# EasyEDA Pro project ProPrj_STM32H723、_2026-06-01.epro, schematic Schematic1

## Sheets
1 P1: Board Name: Board1; Create Date: 2025-07-23; Page Name: P1; Project Name: STM32H723、; Schematic Name: Schematic1; Update Date: 2025-07-23; Company: 嘉立创EDA; Page Size: A4; Version: V1.0
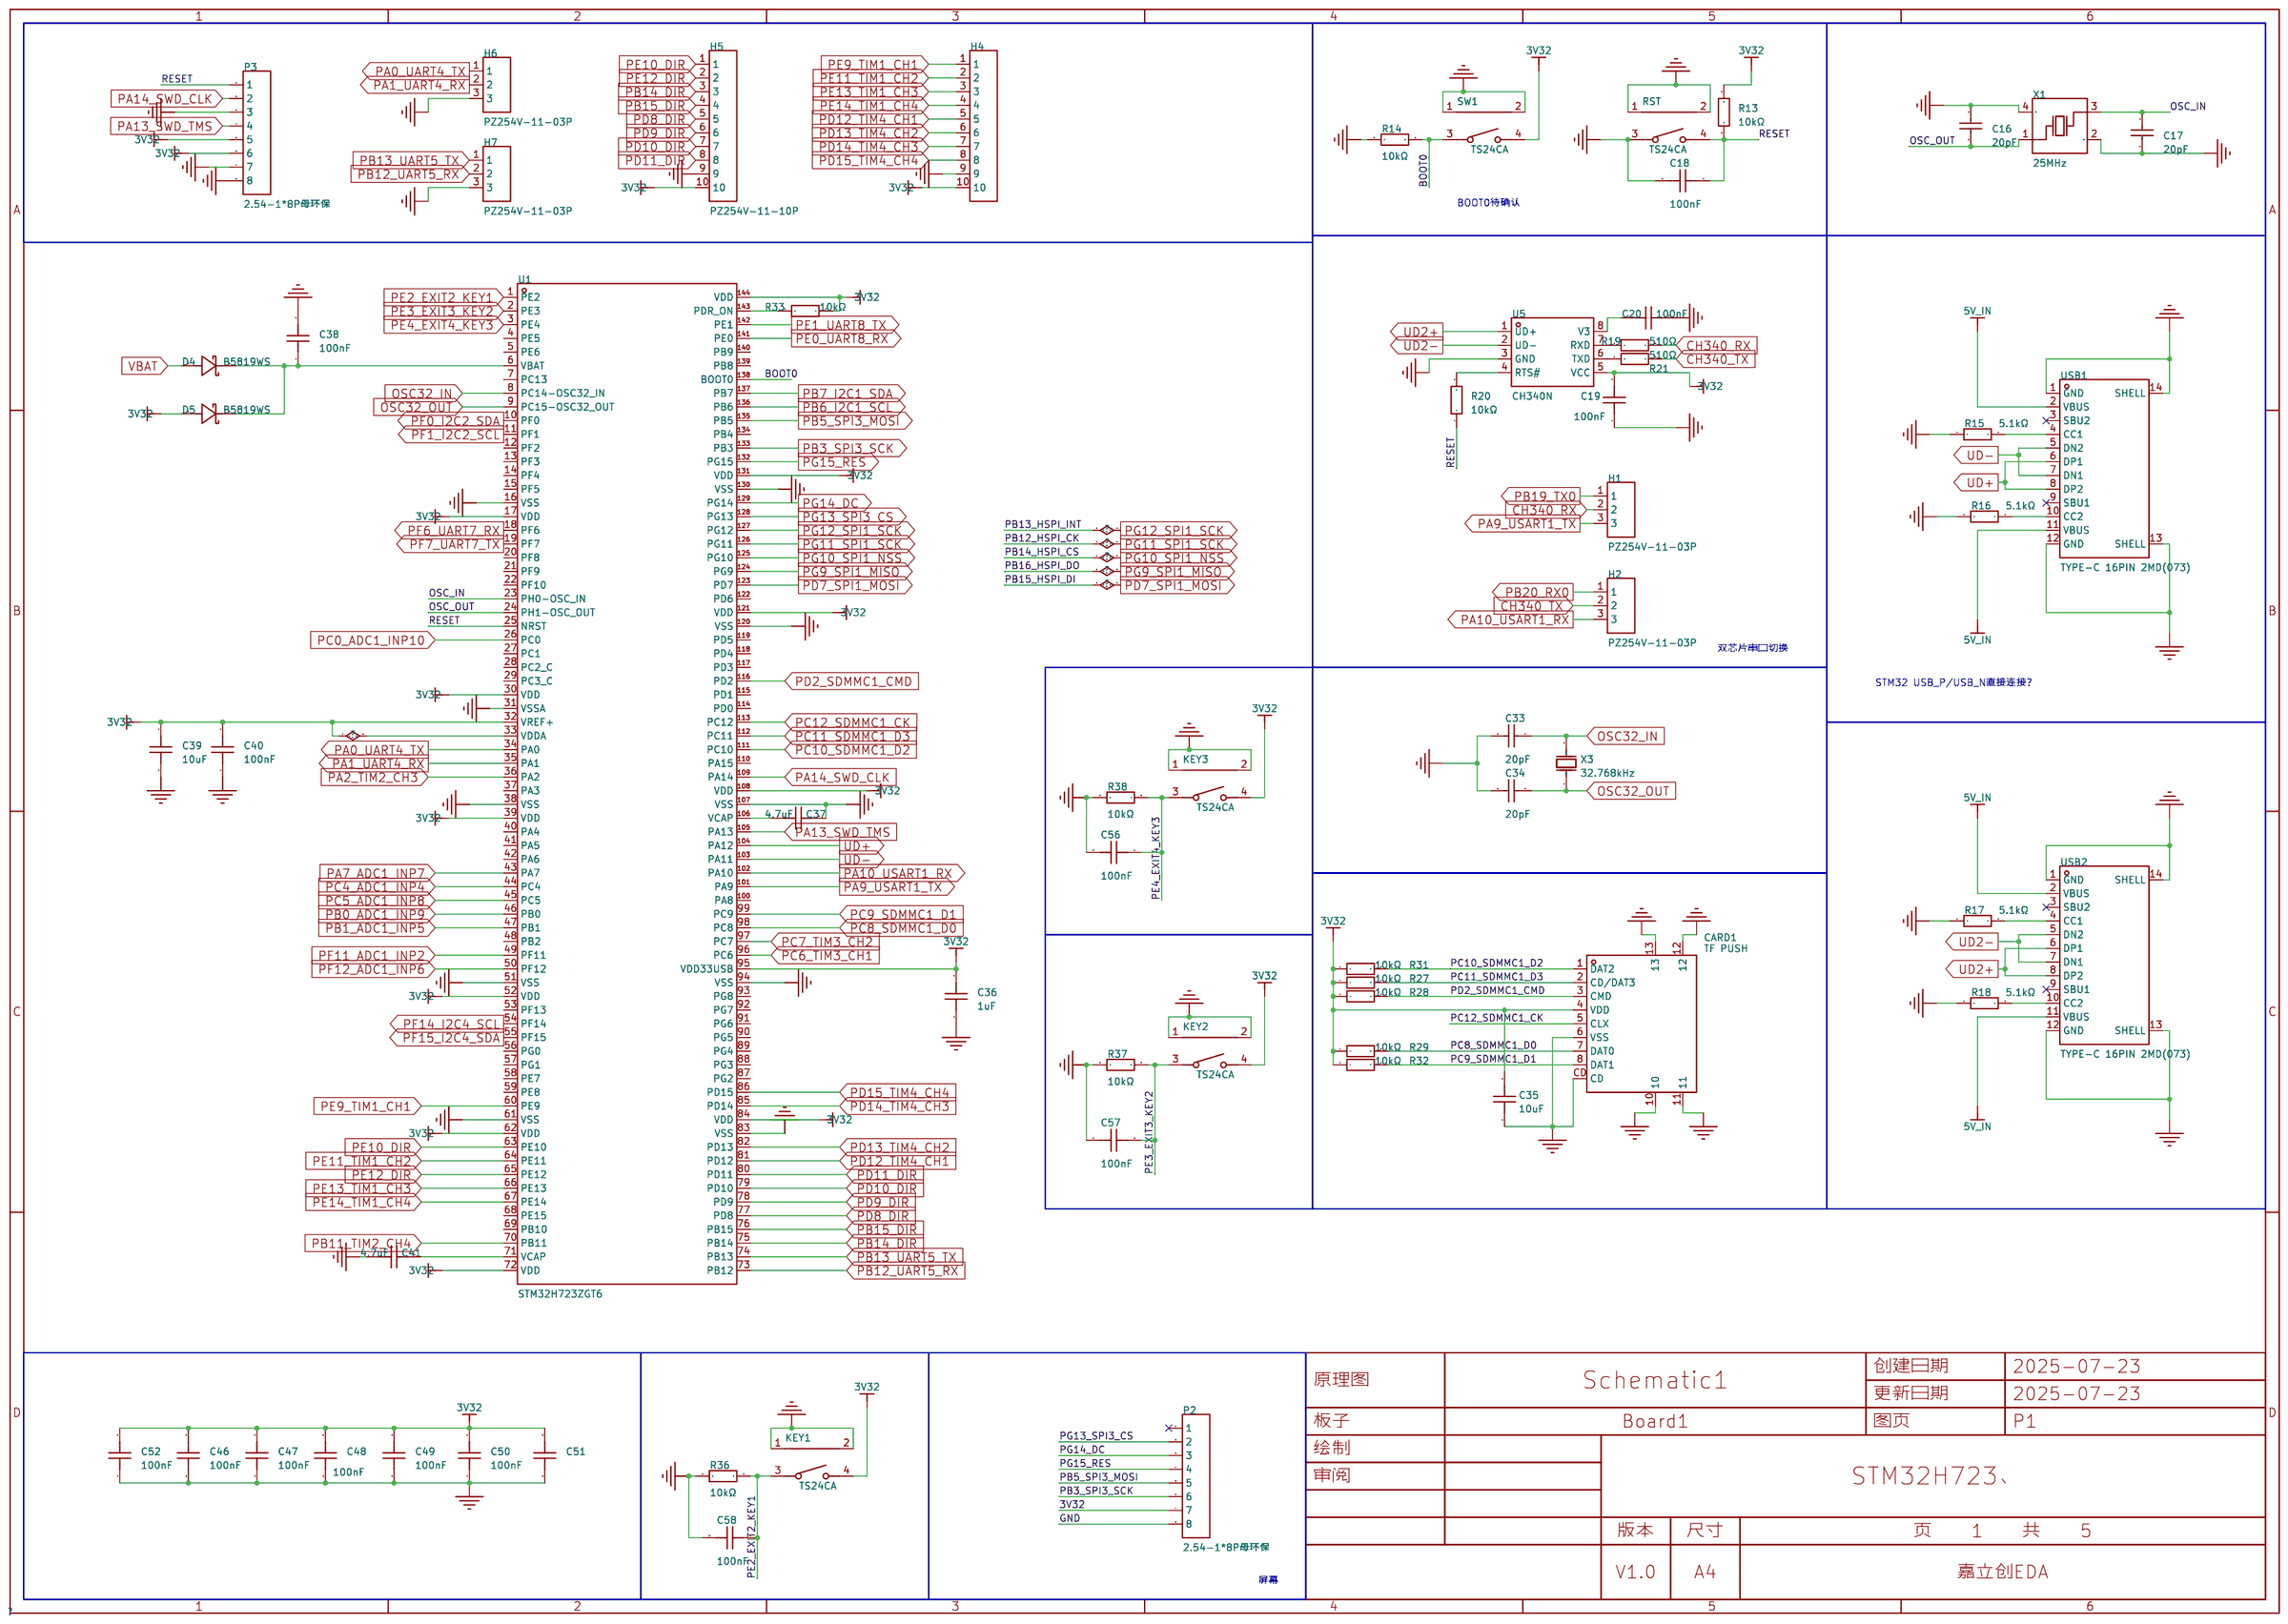
[diagram p0: P1]
2 P2: Create Date: 2025-03-06; Page Name: P2; Project Name: STM32H723_LTS; Update Date: 2025-03-12
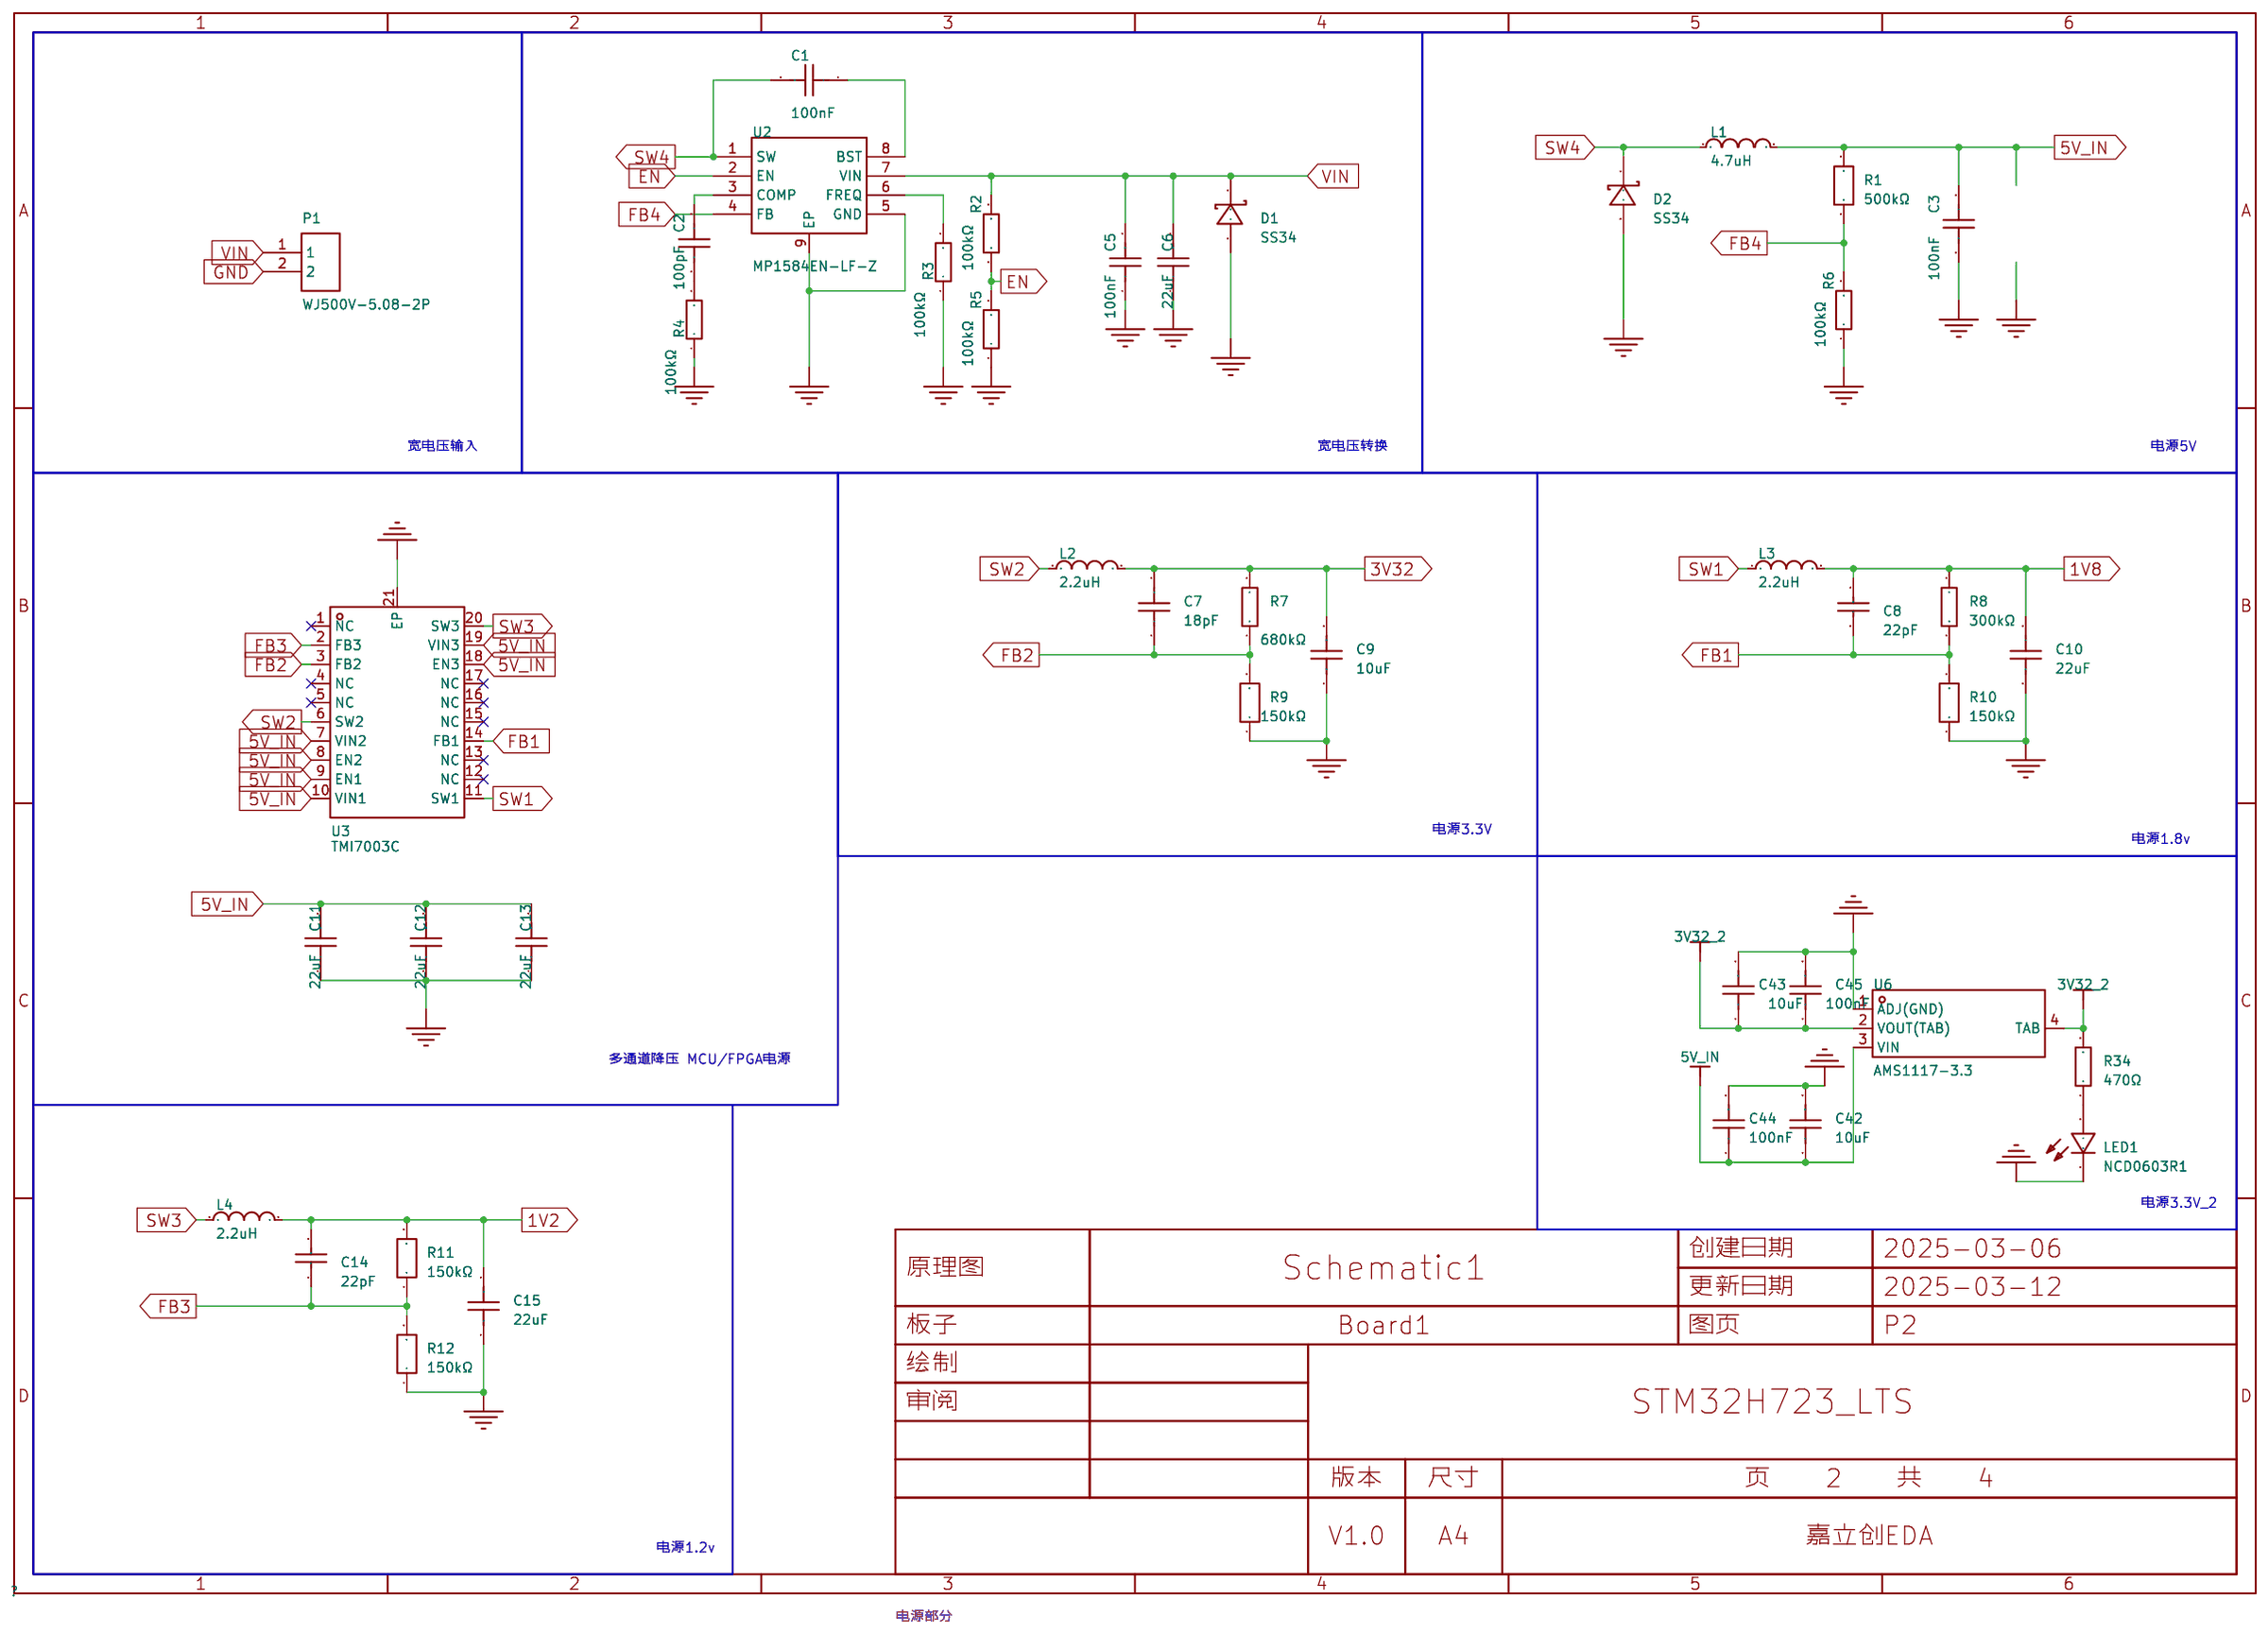
[diagram p1: P2]
3 P4: Page Name: P4
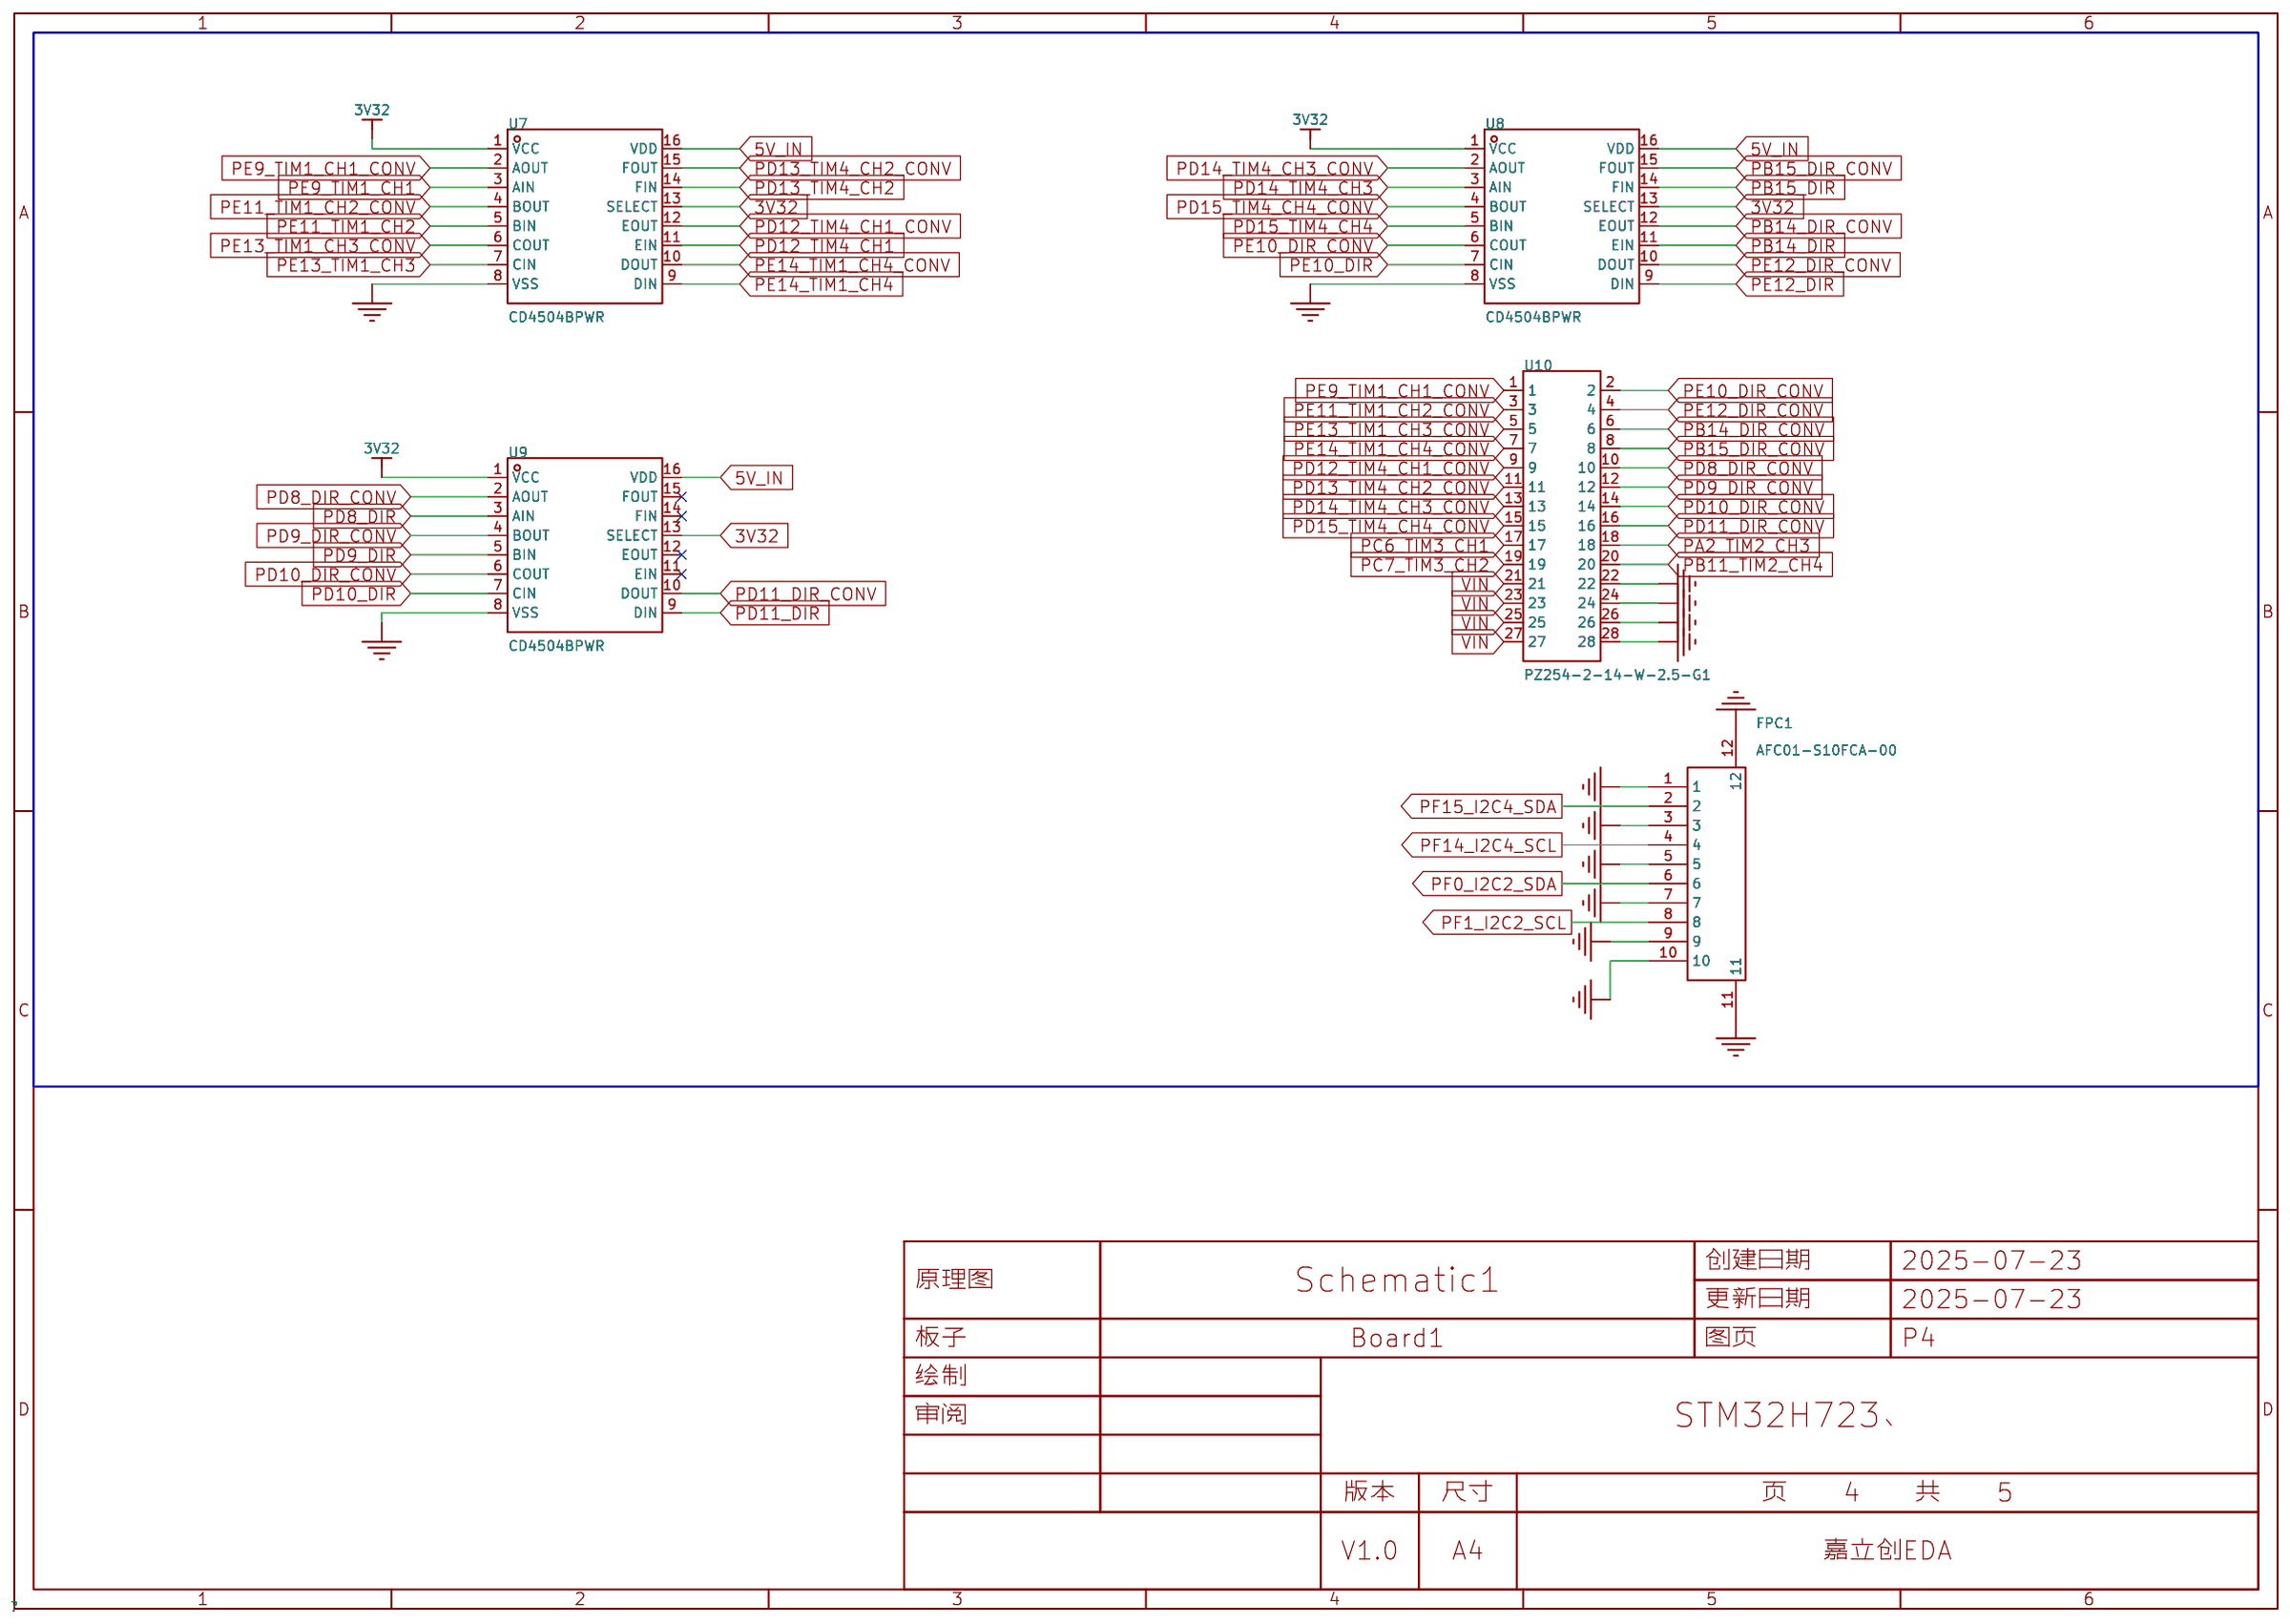
[diagram p2: P4]
4 P5: Page Name: P5
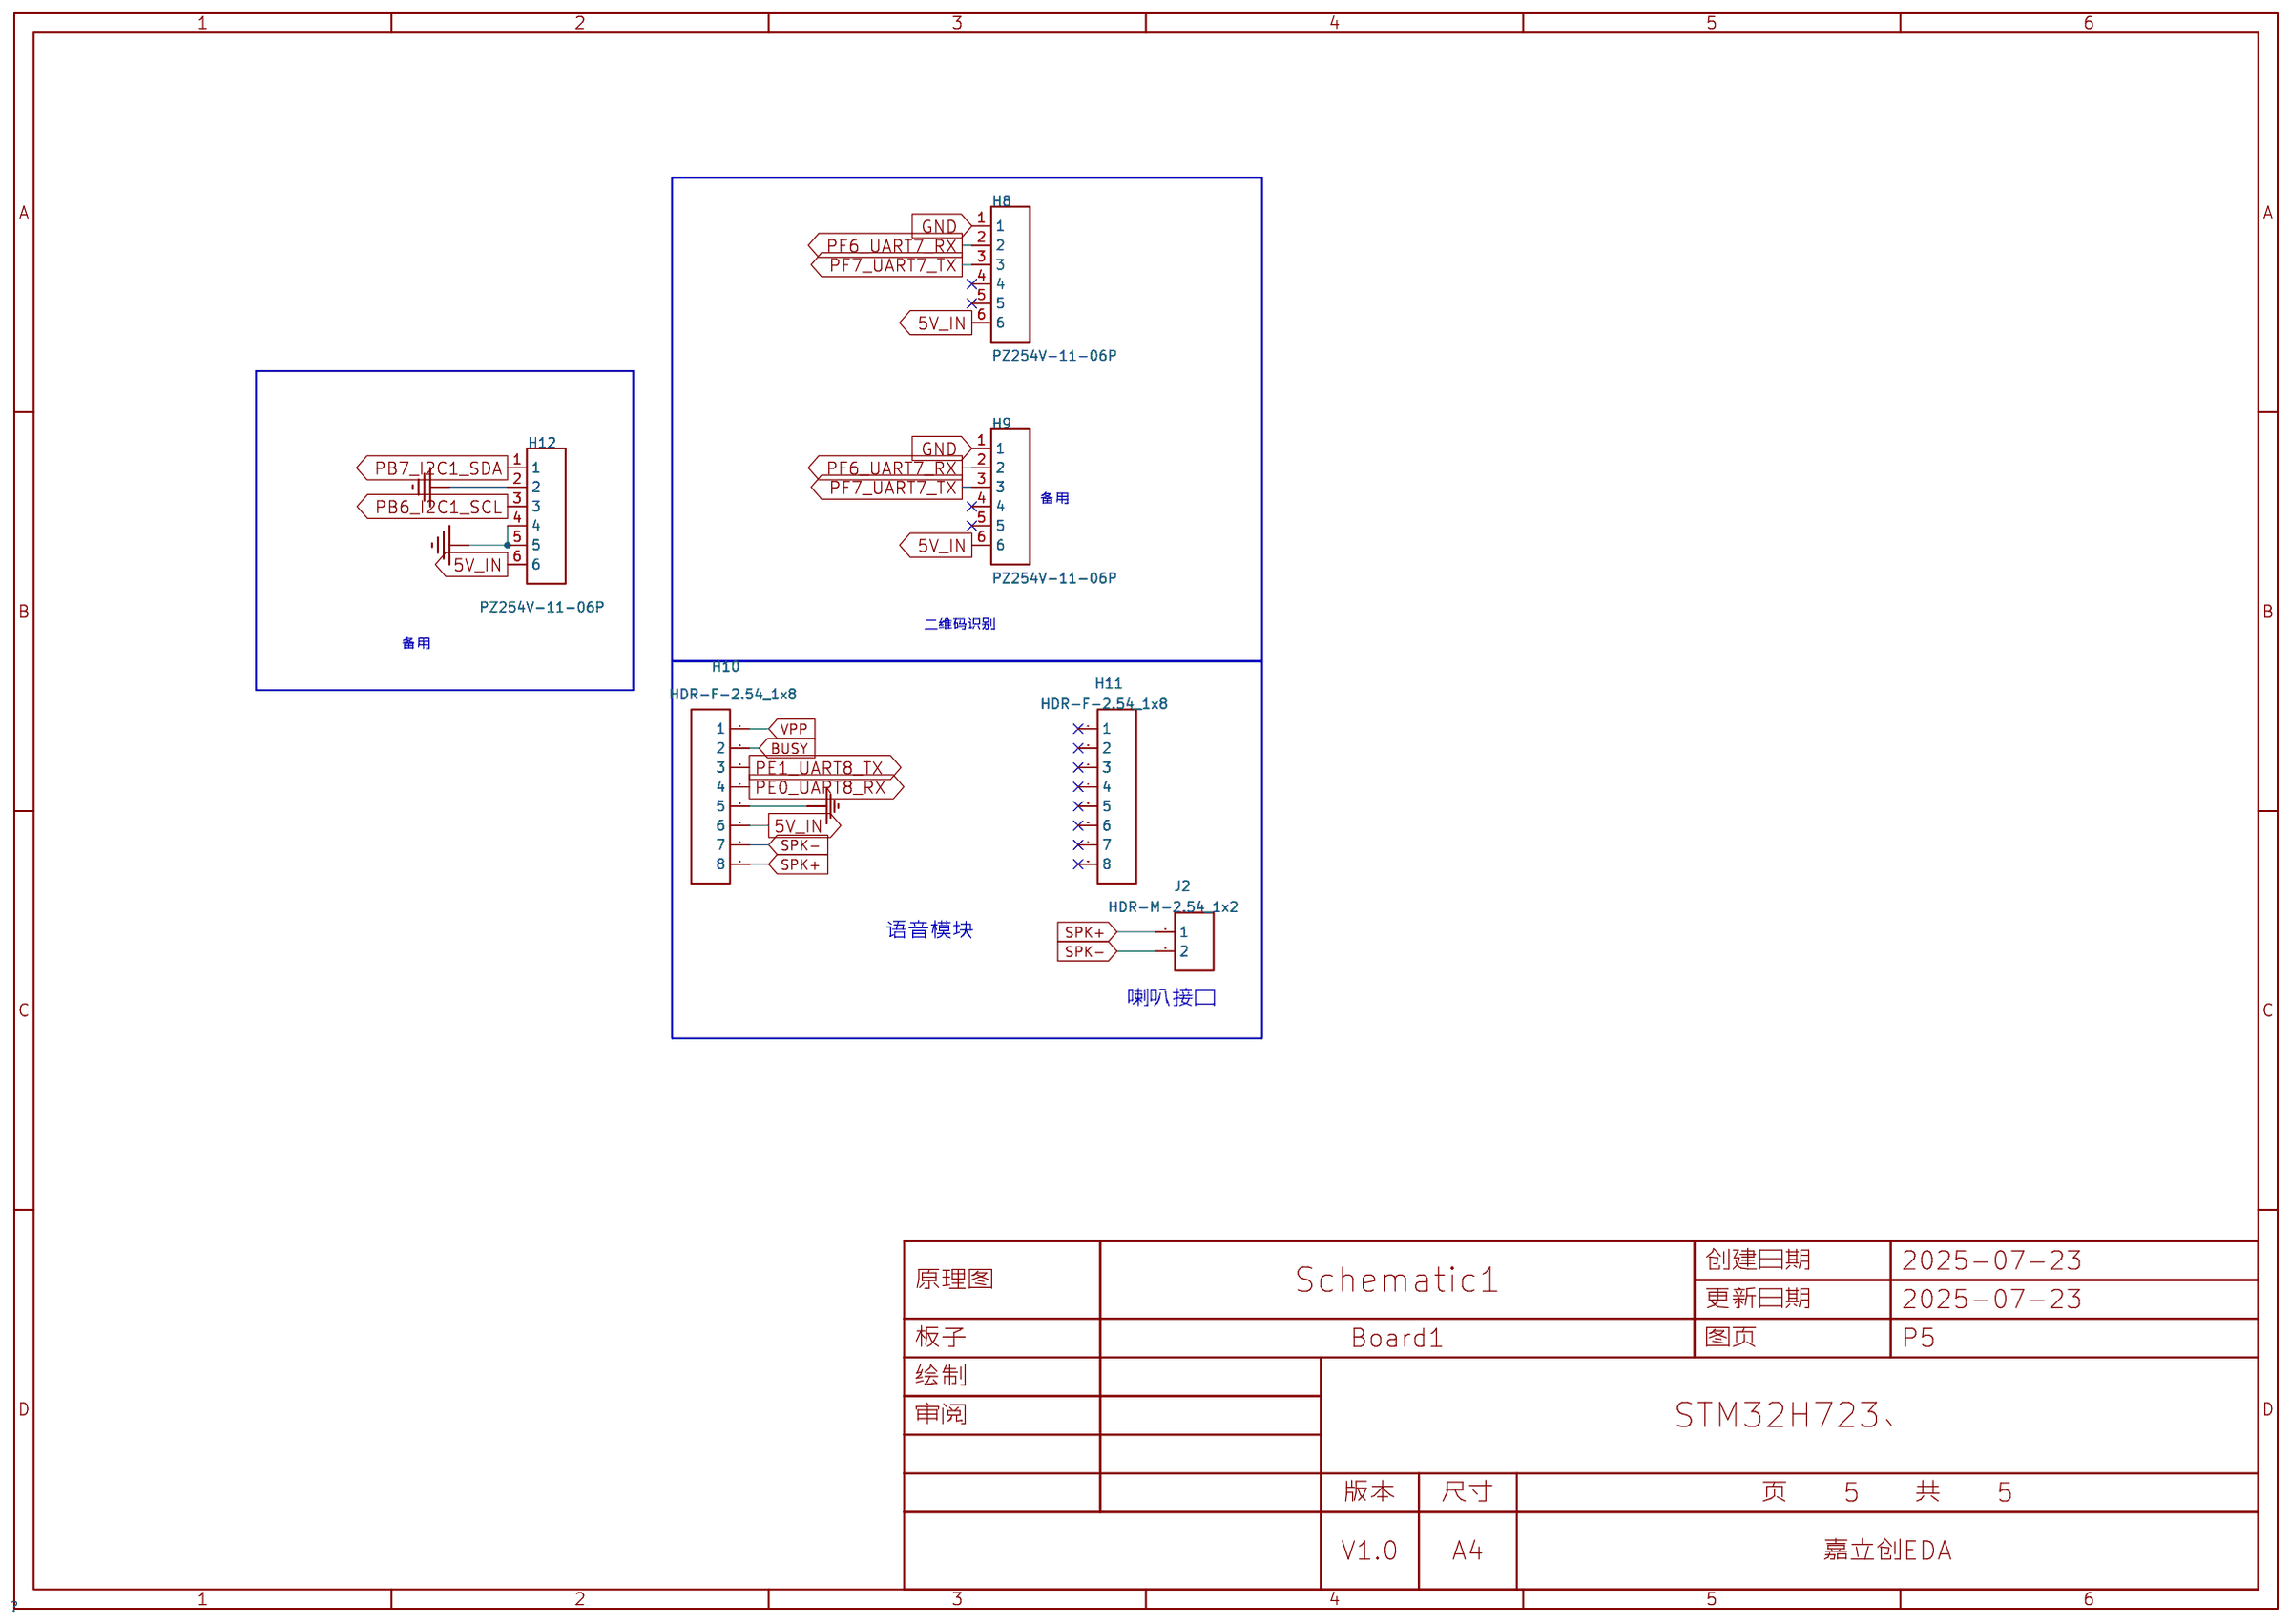
[diagram p3: P5]

## Parts
sheet P1
C16  20pF  [C0603]
C17  20pF  [C0603]
C18  100nF  [C0603]
C19  100nF  [C0603]
C20  100nF  [C0603]
C33  20pF  [C0603]
C34  20pF  [C0603]
C35  10uF  [C0603]
C36  1uF  [C0603]
C37  4.7uF  [C0603]
C38  100nF  [C0603]
C39  10uF  [C0603]
C40  100nF  [C0603]
C41  4.7uF  [C0603]
C46  100nF  [C0603]
C47  100nF  [C0603]
C48  100nF  [C0603]
C49  100nF  [C0603]
C50  100nF  [C0603]
C51  100nF  [C0603]
C52  100nF  [C0603]
C56  100nF  [C0603]
C57  100nF  [C0603]
C58  100nF  [C0603]
CARD1  TF PUSH  [TF-SMD_TF-PUSH]
D4  B5819WS  [SOD-323_L1.7-W1.3-LS2.5-FD]
D5  B5819WS  [SOD-323_L1.7-W1.3-LS2.5-FD]
H1  PZ254V-11-03P  [HDR-TH_3P-P2.54-V-M]
H2  PZ254V-11-03P  [HDR-TH_3P-P2.54-V-M]
H4  PZ254V-11-10P  [HDR-TH_10P-P2.54-V-M]
H5  PZ254V-11-10P  [HDR-TH_10P-P2.54-V-M]
H6  PZ254V-11-03P  [HDR-TH_3P-P2.54-V-M]
H7  PZ254V-11-03P  [HDR-TH_3P-P2.54-V-M]
KEY1  TS24CA  [SW-SMD_TS24CA]
KEY2  TS24CA  [SW-SMD_TS24CA]
KEY3  TS24CA  [SW-SMD_TS24CA]
P2  2.54-1*8P母环保  [HDR-TH_8P-P2.54-V-F-1]
P3  2.54-1*8P母环保  [HDR-TH_8P-P2.54-V-F-1]
R13  10kΩ  [R0603]
R14  10kΩ  [R0603]
R15  5.1kΩ  [R0603]
R16  5.1kΩ  [R0603]
R17  5.1kΩ  [R0603]
R18  5.1kΩ  [R0603]
R19  510Ω  [R0603]
R20  10kΩ  [R0603]
R21  510Ω  [R0603]
R27  10kΩ  [R0603]
R28  10kΩ  [R0603]
R29  10kΩ  [R0603]
R31  10kΩ  [R0603]
R32  10kΩ  [R0603]
R33  10kΩ  [R0603]
R36  10kΩ  [R0603]
R37  10kΩ  [R0603]
R38  10kΩ  [R0603]
RST  TS24CA  [SW-SMD_TS24CA]
SW1  TS24CA  [SW-SMD_TS24CA]
U1  STM32H723ZGT6  [LQFP-144_L20.0-W20.0-P0.50-LS22.0-BL]
U5  CH340N  [SOP-8_L4.9-W3.9-P1.27-LS6.0-BL]
USB1  TYPE-C 16PIN 2MD(073)  [USB-C-SMD_TYPE-C-6PIN-2MD-073]
USB2  TYPE-C 16PIN 2MD(073)  [USB-C-SMD_TYPE-C-6PIN-2MD-073]
X1  25MHz  [CRYSTAL-SMD_4P-L3.2-W2.5-BL]
X3  32.768kHz  [CRYSTAL-SMD_L3.2-W1.5-1]
sheet P2
C1  100nF  [C0603]
C2  100pF  [C0603]
C3  100nF  [C0603]
C5  100nF  [C0603]
C6  22uF  [C0805]
C7  18pF  [C0603]
C8  22pF  [C0603]
C9  10uF  [C0603]
C10  22uF  [C0805]
C11  22uF  [C0805]
C12  22uF  [C0805]
C13  22uF  [C0805]
C14  22pF  [C0603]
C15  22uF  [C0805]
C42  10uF  [C0603]  (no BOM)
C43  10uF  [C0603]  (no BOM)
C44  100nF  [C0603]  (no BOM)
C45  100nF  [C0603]  (no BOM)
D1  SS34  [SMA_L4.3-W2.6-LS5.2-RD]
D2  SS34  [SMA_L4.3-W2.6-LS5.2-RD]
L1  4.7uH  [IND-SMD_L5.4-W5.2_FXL0530]
L2  2.2uH  [IND-SMD_L2.5-W2.0_MHCHL2520]
L3  2.2uH  [IND-SMD_L2.5-W2.0_MHCHL2520]
L4  2.2uH  [IND-SMD_L2.5-W2.0_MHCHL2520]
LED1  NCD0603R1  [LED0603-RD_RED]
P1  WJ500V-5.08-2P  [CONN-TH_2P-P5.00_WJ500V-5.08-2P]
R1  500kΩ  [R0603]
R2  100kΩ  [R0603]
R3  100kΩ  [R0603]
R4  100kΩ  [R0603]
R5  100kΩ  [R0603]
R6  100kΩ  [R0603]
R7  680kΩ  [R0603]
R8  300kΩ  [R0603]
R9  150kΩ  [R0603]
R10  150kΩ  [R0603]
R11  150kΩ  [R0603]
R12  150kΩ  [R0603]
R34  470Ω  [R0603]  (no BOM)
U2  MP1584EN-LF-Z  [SOIC-8_L5.0-W4.0-P1.27-LS6.0-BL-EP2.0]
U3  TMI7003C  [QFN-20_L3.0-W3.0-P0.40-BL-EP1.9]
U6  AMS1117-3.3  [SOT-223-4_L6.5-W3.5-P2.30-LS7.0-BR]
sheet P4
FPC1  AFC01-S10FCA-00  [FPC-SMD_P0.5-10P_FGS-XJ-H2.0]
U7  CD4504BPWR  [TSSOP-16_L5.0-W4.4-P0.65-LS6.4-TL]
U8  CD4504BPWR  [TSSOP-16_L5.0-W4.4-P0.65-LS6.4-TL]
U9  CD4504BPWR  [TSSOP-16_L5.0-W4.4-P0.65-LS6.4-TL]
U10  PZ254-2-14-W-2.5-G1  [HDR-TH_28P-P2.54-H-M-R2-C14-S2.54]
sheet P5
H8  PZ254V-11-06P  [HDR-TH_6P-P2.54-V-M]
H9  PZ254V-11-06P  [HDR-TH_6P-P2.54-V-M]
H10  HDR-F-2.54_1x8  [HDR-F-2.54_1X8]
H11  HDR-F-2.54_1x8  [HDR-F-2.54_1X8]
H12  PZ254V-11-06P  [HDR-TH_6P-P2.54-V-M]
J2  HDR-M-2.54_1x2  [HDR-M-2.54_1X2]

## Library data of the parts
C16 C17 C33 C34 = CL10C200JB8NNNC: 容值:20pF;精度:±5%;额定电压:50V;材质(温度系数):C0G;; LCSC Part Name: 20pF ±5% 50V; Supplier Part: C1648; Manufacturer: SAMSUNG(三星); Supplier Footprint: 0603; JLCPCB Part Class: 基础库; Datasheet: https://atta.szlcsc.com/upload/public/pdf/source/20160218/1457707763339.pdf; Supplier: LCSC; Tolerance: ±5%; Voltage Rated: 50V; Temperature Coefficient: C0G
C18 C44 C45 C56-C58 = CC0603KRX7R9BB104: 容值:100nF;精度:±10%;额定电压:50V;材质(温度系数):X7R;; LCSC Part Name: 100nF ±10% 50V; Supplier Part: C14663; Manufacturer: YAGEO(国巨); Supplier Footprint: 0603; JLCPCB Part Class: 基础库; Datasheet: https://atta.szlcsc.com/upload/public/pdf/source/20180910/C282072_33301C7F631E79921B82A8DAC6BCC5B3.pdf; Supplier: LCSC; Tolerance: ±10%; Voltage Rated: 50V; Temperature Coefficient: X7R; Check: true
C1 C3 C5 C19 C20 C38 C40 C46-C52 = CGA0603X7R104K500JT: 容值:100nF;精度:±10%;额定电压:50V;材质(温度系数):X7R;; LCSC Part Name: 100nF ±10% 50V; Supplier Part: C6119867; Manufacturer: HRE(芯声); Supplier Footprint: 0603; JLCPCB Part Class: 扩展库; Supplier: LCSC; Tolerance: ±10%; Voltage Rated: 50V; Temperature Coefficient: X7R
C35 C39 C42 C43 = CGA0603X5R106K100JT: 容值:10uF;精度:±10%;额定电压:10V;材质(温度系数):X5R;; LCSC Part Name: 10uF ±10% 10V; Supplier Part: C6119842; Manufacturer: HRE(芯声); Supplier Footprint: 0603; JLCPCB Part Class: 扩展库; Supplier: LCSC; Tolerance: ±10%; Voltage Rated: 10V; Temperature Coefficient: X5R; Check: true
C36 = CGA0603X5R105K500JT: 容值:1uF;精度:±10%;额定电压:50V;材质(温度系数):X5R;; LCSC Part Name: 1uF ±10% 50V; Supplier Part: C6119852; Manufacturer: HRE(芯声); Supplier Footprint: 0603; JLCPCB Part Class: 扩展库; Supplier: LCSC; Tolerance: ±10%; Voltage Rated: 50V; Temperature Coefficient: X5R
C37 C41 = CL10A475KO8NNNC: 容值:4.7uF;精度:±10%;额定电压:16V;材质(温度系数):X5R;; LCSC Part Name: 4.7uF ±10% 16V; Supplier Part: C19666; Manufacturer: SAMSUNG(三星); Supplier Footprint: 0603; JLCPCB Part Class: 基础库; Datasheet: https://atta.szlcsc.com/upload/public/pdf/source/20160218/1457707763339.pdf; Supplier: LCSC; Tolerance: ±10%; Voltage Rated: 16V; Temperature Coefficient: X5R
CARD1 = TF PUSH: 卡连接方式:自弹式;卡类型:MicroSD卡(TF卡);连接器类型:卡座;本体最大高度:2mm;工作温度范围:-20℃~+90℃;; LCSC Part Name: 自弹式 MicroSD卡(TF卡) 卡座; Supplier Part: C393941; Manufacturer: SHOU HAN(首韩); Supplier Footprint: SMD; JLCPCB Part Class: 扩展库; Datasheet: https://atta.szlcsc.com/upload/public/pdf/source/20191011/C393941_0DDD896EE907FEB750D8B7B8982E2A67.pdf; Supplier: LCSC; Card Connection Mode: 自弹式; Card Type: MicroSD卡(TF卡); Connector Type: 卡座; Additional Card Detection Pins: 无; Maximum Body Height: 2mm; Operating Temperature Range: -20℃~+90℃; Check: true
D4 D5 = B5819WS_C7420331: 二极管配置:独立式;正向压降(Vf):600mV@1.0A;直流反向耐压(Vr):40V;整流电流:1A;; LCSC Part Name: 电压:40V 电流:1A; Supplier Part: C7420331; Manufacturer: 宏迦橙; Supplier Footprint: SOD-323; JLCPCB Part Class: 扩展库; Datasheet: https://atta.szlcsc.com/upload/public/pdf/source/20230828/03CA0F4F90DAE368A7153B7B5E4D0651.pdf; Supplier: LCSC; Diode Configuration: 独立式; Forward Voltage (Vf@If): 600mV@1.0A; Reverse Voltage (Vr): 40V; Rectified Current: 1A; Reverse Leakage Current (Ir): 1mA@40V
H1 H2 H6 H7 = PZ254V-11-03P: 插针结构:1x3P;间距:2.54mm;行距:-;圆针/方针:方针;安装方式:直插;排数:单排;总PIN位数:3P;额定电流:3A;额定电压:250V;配合针长度:6mm;塑高:2.5mm;端接针长度:3mm;工作温度:-40℃~+105℃;颜色:黑色;; LCSC Part Name: 1x3P 间距:2.54mm 方针 直插; Supplier Part: C2937625; Manufacturer: XFCN(兴飞); Supplier Footprint: 插件,P=2.54mm; JLCPCB Part Class: 扩展库; Datasheet: https://atta.szlcsc.com/upload/public/pdf/source/20200309/C492402_8335C3D49C4E4C618838D59BB1D024C1.pdf; Supplier: LCSC; Pin Structure: 1x3P; Pitch: 2.54mm; Circluar Pins/Square Pins: 方针; Mounting Type: 直插; Number of Rows: 单排; Number of Pins: 3P; Current Rating: 3A; Voltage Rating (Max): 250V; Length of Mating Pin: 6mm; Insulation Height: 2.5mm; Length of End Connection Pin: 3mm; Operating Temperature: -40℃~+105℃; Color: 黑色
H4 H5 = PZ254V-11-10P: 插针结构:1x10P;间距:2.54mm;行距:-;圆针/方针:方针;安装方式:直插;排数:单排;总PIN位数:10P;额定电流:-;额定电压:-;配合针长度:6mm;塑高:2.5mm;端接针长度:3mm;触头材质:黄铜;触头镀层:-;工作温度:-40℃~+105℃;颜色:黑色;; LCSC Part Name: 1x10P 间距:2.54mm 方针 直插; Supplier Part: C492409; Manufacturer: XFCN(兴飞); Supplier Footprint: 插件,P=2.54mm; JLCPCB Part Class: 扩展库; Datasheet: https://atta.szlcsc.com/upload/public/pdf/source/20200309/C492409_129C9431BDD62EBBBD0A643B6AAB9FBD.pdf; Supplier: LCSC; Pin Structure: 1x10P; Pitch: 2.54mm; Circluar Pins/Square Pins: 方针; Mounting Type: 直插; Number of Rows: 单排; Number of Pins: 10P; Length of Mating Pin: 6mm; Insulation Height: 2.5mm; Length of End Connection Pin: 3mm; Contact Material: 黄铜; Operating Temperature: -40℃~+105℃; Color: 黑色
KEY1-KEY3 RST SW1 = TS24CA: 电路结构:单刀单掷;按钮形状:矩形按钮;安装方式:卧贴;开关长度:4.55mm;开关宽度:1.8mm;开关高度:3.5mm;触点电流:50mA;额定电压(DC):12V;带灯:-;机械寿命:-;; LCSC Part Name: 4.55*1.8*3.5mm 卧贴 轻触开关; Supplier Part: C393942; Manufacturer: SHOU HAN(首韩); Supplier Footprint: SMD; JLCPCB Part Class: 扩展库; Datasheet: https://atta.szlcsc.com/upload/public/pdf/source/20190521/C393942_591A9E318887EFA4274D34029981AD99.pdf; Supplier: LCSC; Circuit: 单刀单掷; Actuator Style: 矩形按钮; Mounting Style: 卧贴; Switch Length: 4.55mm; Switch Width: 1.8mm; Switch Height: 3.5mm; Contact Current: 50mA; Voltage Rating (DC): 12V
P2 P3 = 2.54-1*8P母环保: 插孔结构:1x8P;间距:2.54mm;行距:-;安装类型:直插;排数:单排;总孔位数:8P;塑高:-;触头材质:-;触头镀层:-;; LCSC Part Name: 间距:2.54mm 1x8P 直插; Supplier Part: C27438; Manufacturer: BOOMELE(博穆精密); Supplier Footprint: 插件,P=2.54mm; JLCPCB Part Class: 扩展库; Datasheet: https://atta.szlcsc.com/upload/public/pdf/source/20231221/1CA800C6799ED97958773716FAA1BFFE.pdf; Supplier: LCSC; Holes Structure: 1x8P; Pitch: 2.54mm; Mounting Type: 直插; Number of Rows: 单排; Number of Holes: 8P; Check: true
R13 R14 R20 R33 R36-R38 = 0603WAF1002T5E: 电阻类型:厚膜电阻;阻值:10kΩ;精度:±1%;功率:100mW;最大工作电压:75V;温度系数:±100ppm/℃;; LCSC Part Name: 厚膜电阻 10kΩ ±1% 100mW; Supplier Part: C25804; Manufacturer: UNI-ROYAL(厚声); Supplier Footprint: 0603; JLCPCB Part Class: 基础库; Datasheet: https://atta.szlcsc.com/upload/public/pdf/source/20200306/C422600_1E6D84923E4A46A82E41ADD87F860B5C.pdf; Supplier: LCSC; Type: 厚膜电阻; Tolerance: ±1%; Power(Watts): 100mW; Overload Voltage (Max): 75V; Temperature Coefficient: ±100ppm/℃; Operating Temperature Range: -55℃~+155℃
R15-R18 = 0603WAF5101T5E: 电阻类型:厚膜电阻;阻值:5.1kΩ;精度:±1%;功率:100mW;最大工作电压:75V;温度系数:±100ppm/℃;; LCSC Part Name: 5.1kΩ ±1% 100mW 厚膜电阻; Supplier Part: C23186; Manufacturer: UNI-ROYAL(厚声); Supplier Footprint: 0603; JLCPCB Part Class: 基础库; Datasheet: https://atta.szlcsc.com/upload/public/pdf/source/20200306/C422600_1E6D84923E4A46A82E41ADD87F860B5C.pdf; Supplier: LCSC; Type: 厚膜电阻; Tolerance: ±1%; Power(Watts): 100mW; Overload Voltage (Max): 75V; Temperature Coefficient: ±100ppm/℃; Operating Temperature Range: -55℃~+155℃; Check: true
R19 R21 = 0603WAF5100T5E: 电阻类型:厚膜电阻;阻值:510Ω;精度:±1%;功率:100mW;最大工作电压:75V;温度系数:±100ppm/℃;; LCSC Part Name: 510Ω ±1% 100mW 厚膜电阻; Supplier Part: C23193; Manufacturer: UNI-ROYAL(厚声); Supplier Footprint: 0603; JLCPCB Part Class: 基础库; Datasheet: https://atta.szlcsc.com/upload/public/pdf/source/20200306/C422600_1E6D84923E4A46A82E41ADD87F860B5C.pdf; Supplier: LCSC; Type: 厚膜电阻; Tolerance: ±1%; Power(Watts): 100mW; Overload Voltage (Max): 75V; Temperature Coefficient: ±100ppm/℃; Operating Temperature Range: -55℃~+155℃
R27-R29 R31 R32 = RC0603FR-0710KL: 电阻类型:厚膜电阻;阻值:10kΩ;精度:±1%;功率:100mW;最大工作电压:75V;温度系数:±100ppm/℃;; LCSC Part Name: 厚膜电阻 10kΩ ±1% 100mW; Supplier Part: C98220; Manufacturer: YAGEO(国巨); Supplier Footprint: 0603; JLCPCB Part Class: 扩展库; Datasheet: https://atta.szlcsc.com/upload/public/pdf/source/20180927/C295883_E8D83085EA81BD7DE0B2B681138C15EE.pdf; Supplier: LCSC; Type: 厚膜电阻; Tolerance: ±1%; Power(Watts): 100mW; Overload Voltage (Max): 75V; Temperature Coefficient: ±100ppm/℃; Operating Temperature Range: -55℃~+155℃; Check: true
U1 = STM32H723ZGT6: CPU内核:-;程序存储容量:1MB;RAM总容量:564KB;GPIO端口数量:112;工作电压范围:1.71V~3.6V;CPU最大主频:550MHz;程序存储器类型:FLASH;应用领域:-;; LCSC Part Name: 高性能，带有DP-FPU的DSP，基于Arm Cortex-M7的MCU，配备1 M字节的Flash，564 KB的RAM，550 MHz的CPU，L1缓存，外部内存接口，部分外围设备子集; Supplier Part: C730146; Manufacturer: ST(意法半导体); Supplier Footprint: LQFP-144(20x20); JLCPCB Part Class: 扩展库; Datasheet: https://atta.szlcsc.com/upload/public/pdf/source/20200902/C730141_32325B298F902737689CA9A88D6BD2F2.pdf; Supplier: LCSC; Program Storage Size: 1MB; RAM Size: 564KB; GPIO Ports Number: 112; Operating Voltage Range: 1.71V~3.6V; CPU Maximum Speed: 550MHz; Program Memory Type: FLASH; Operating Temperature Range: -40℃~+85℃; ADC (Bit): 12bit；16bit; DAC (Bit): 12bit; Universal Serial Bus: 有; Peripheral/Function: DMA；LCD/LED驱动；PWM; Watchdog: 有; Infrared Data Association: 有; Low-Voltage Detect: 有; LCD Module: 有; Secure Digital Input and Output: 有; Direct Memory Access: 有; Internal Oscillator: 有
U5 = CH340N: 应用功能:USB转串口;接口协议:USB 2.0;通道数:1;数据速率:2Mbps;; LCSC Part Name: USB转串口芯片CH340; Supplier Part: C2977777; Manufacturer: WCH(南京沁恒); Supplier Footprint: SOP-8; JLCPCB Part Class: 扩展库; Datasheet: https://atta.szlcsc.com/upload/public/pdf/source/20240313/115CDE92081B1D6CB446704AD5D0F5F2.pdf; Supplier: LCSC; Applications Function: USB转串口; Protocol: USB 2.0; Number of Channels: 1; Supply Voltage: 3.3V；5V; Data Rate: 2Mbps; Operating Temperature: -20℃~+70℃
USB1 USB2 = TYPE-C 16PIN 2MD(073): 连接器类型:Type-C;标准:USB 3.1;公母:母;安装方式:卧贴;触点数量:16P;端口数量:1;额定电流 - 电源:5A;工作温度范围:-25℃~+85℃;; LCSC Part Name: Type-C 母 卧贴; Supplier Part: C2765186; Manufacturer: SHOU HAN(首韩); Supplier Footprint: SMD; JLCPCB Part Class: 扩展库; Datasheet: https://atta.szlcsc.com/upload/public/pdf/source/20211123/39B17C16241EAC15C5E277BDA434118E.pdf; Supplier: LCSC; Connector Type: Type-C; Standard: USB 3.1; Gender: 母; Mounting Style: 卧贴; Number of Contacts: 16P; Number of Ports: 1; Current Rating - Power (Max): 5A; Operating Temperature Range: -25℃~+85℃; Rated Voltage (Max): 5V; Connect-Disconnect Life: 5千次; Core Colour: 黑色
X1 = X322525MOB4SI: 晶振类型:贴片晶振;频率:25MHz;常温频差:±10ppm;负载电容:12pF;频率稳定度:±20ppm;; LCSC Part Name: 25MHz ±10ppm 12pF; Supplier Part: C9006; Manufacturer: YXC(扬兴晶振); Supplier Footprint: SMD3225-4P; JLCPCB Part Class: 基础库; Datasheet: https://atta.szlcsc.com/upload/public/pdf/source/20240329/19D5F850207469550BEB00D7DFEDBC7A.pdf; Supplier: LCSC; Type: 贴片晶振; Normal temperature Frequency Tolerance: ±10ppm; Load Capacitance: 12pF; Frequency Stability: ±20ppm; Operating Temperature: -40℃~+85℃
X3 = XKXGI-SUA-32.768K: 晶振类型:贴片晶振;频率:32.768kHz;常温频差:±20ppm;负载电容:12.5pF;频率稳定度:±30ppm;; LCSC Part Name: 32.768kHz ±20ppm 12.5pF; Supplier Part: C5213671; Manufacturer: YXC(扬兴晶振); Supplier Footprint: SMD3215-2P; JLCPCB Part Class: 扩展库; Datasheet: https://atta.szlcsc.com/upload/public/pdf/source/20240329/3A7650FD985DD0DE85694D3785AB4916.pdf; Supplier: LCSC; Type: 贴片晶振; Normal temperature Frequency Tolerance: ±20ppm; Load Capacitance: 12.5pF; Frequency Stability: ±30ppm; Operating Temperature: -40℃~+85℃
C2 = CC0603JRNPO9BN101: 容值:100pF;精度:±5%;额定电压:50V;材质(温度系数):NP0;; LCSC Part Name: 100pF ±5% 50V; Supplier Part: C14665; Manufacturer: YAGEO(国巨); Supplier Footprint: 0603; JLCPCB Part Class: 扩展库; Datasheet: https://atta.szlcsc.com/upload/public/pdf/source/20181008/C309499_21CC21451B82C39E3D92150FD6B30293.pdf; Supplier: LCSC; Tolerance: ±5%; Voltage Rated: 50V; Temperature Coefficient: NP0
C6 C10-C13 C15 = CGA0805X5R226M350MT: 容值:22uF;精度:±20%;额定电压:35V;材质(温度系数):X5R;; LCSC Part Name: 22uF ±20% 35V; Supplier Part: C6119901; Manufacturer: HRE(芯声); Supplier Footprint: 0805; JLCPCB Part Class: 扩展库; Datasheet: https://atta.szlcsc.com/upload/public/pdf/source/20231129/D589D0CC4D260F7AC3A77E53B455CCB3.pdf; Supplier: LCSC; Tolerance: ±20%; Voltage Rated: 35V; Temperature Coefficient: X5R
C7 = FCC0603N180J500CT: 容值:18pF;精度:±5%;额定电压:50V;材质(温度系数):C0G;; LCSC Part Name: 18pF ±5% 50V; Supplier Part: C5137620; Manufacturer: FOJAN(富捷); Supplier Footprint: 0603; JLCPCB Part Class: 扩展库; Datasheet: https://atta.szlcsc.com/upload/public/pdf/source/20220818/0EB3B7FB2F5648AC16609637FBA7DABE.pdf; Supplier: LCSC; Tolerance: ±5%; Voltage Rated: 50V; Temperature Coefficient: C0G
C8 = CC0603JRNPO9BN220: 容值:22pF;精度:±5%;额定电压:50V;材质(温度系数):NP0;; LCSC Part Name: 22pF ±5% 50V; Supplier Part: C105620; Manufacturer: YAGEO(国巨); Supplier Footprint: 0603; JLCPCB Part Class: 扩展库; Datasheet: https://atta.szlcsc.com/upload/public/pdf/source/20170505/1493957838062.pdf; Supplier: LCSC; Tolerance: ±5%; Voltage Rated: 50V; Temperature Coefficient: NP0
C9 = CGA0603X5R106K100JT: 容值:10uF;精度:±10%;额定电压:10V;材质(温度系数):X5R;; LCSC Part Name: 10uF ±10% 10V; Supplier Part: C6119842; Manufacturer: HRE(芯声); Supplier Footprint: 0603; JLCPCB Part Class: 扩展库; Supplier: LCSC; Tolerance: ±10%; Voltage Rated: 10V; Temperature Coefficient: X5R
C14 = CC0603JRNPO9BN220: 容值:22pF;精度:±5%;额定电压:50V;材质(温度系数):NP0;; LCSC Part Name: 22pF ±5% 50V; Supplier Part: C105620; Manufacturer: YAGEO(国巨); Supplier Footprint: 0603; JLCPCB Part Class: Extended Part; Datasheet: https://atta.szlcsc.com/upload/public/pdf/source/20170505/1493957838062.pdf; Supplier: LCSC; Tolerance: ±5%; Voltage Rated: 50V; Temperature Coefficient: NP0
D1 D2 = SS34_C8678: 二极管配置:独立式;正向压降(Vf):550mV@3A;直流反向耐压(Vr):40V;整流电流:3A;; LCSC Part Name: 电压:40V 电流:3A; Supplier Part: C8678; Manufacturer: MDD(辰达半导体); Supplier Footprint: SMA(DO-214AC); JLCPCB Part Class: 基础库; Datasheet: https://atta.szlcsc.com/upload/public/pdf/source/20240710/2118BB86FDDB2E0B294389AC1F3F65C8.pdf; Supplier: LCSC; Diode Configuration: 独立式; Forward Voltage (Vf@If): 550mV@3A; Reverse Voltage (Vr): 40V; Rectified Current: 3A; Reverse Leakage Current (Ir): 500uA@40V
L1 = FXL0530-4R7-M: 电感值:4.7uH;精度:±20%;额定电流:4.5A;饱和电流(Isat):5A;类型:一体成型电感;; LCSC Part Name: 4.7uH ±20% 5A; Supplier Part: C177246; Manufacturer: cjiang(长江微电); Supplier Footprint: SMD,5.2x5.4mm; JLCPCB Part Class: 扩展库; Datasheet: https://atta.szlcsc.com/upload/public/pdf/source/20240426/3189EA8206330E2108542F9E34E540E7.pdf; Supplier: LCSC; Tolerance: ±20%; Rated Current: 4.5A; Saturation Current (Isat): 5A; DC Resistance (DCR): 60mΩ; Type: 一体成型电感
L2-L4 = FTC252012S2R2MBCA: 电感值:2.2uH;精度:±20%;额定电流:3A;饱和电流(Isat):3.8A;类型:一体成型电感;; LCSC Part Name: 2.2uH ±20% 3.8A; Supplier Part: C5832372; Manufacturer: cjiang(长江微电); Supplier Footprint: 1008; JLCPCB Part Class: 扩展库; Datasheet: https://atta.szlcsc.com/upload/public/pdf/source/20230602/8FFEDA9C0247A92A0D4B67554BFE4091.pdf; Supplier: LCSC; Tolerance: ±20%; Rated Current: 3A; Saturation Current (Isat): 3.8A; DC Resistance (DCR): 55mΩ; Type: 一体成型电感
LED1 = NCD0603R1_C84263: 灯头类型:-;发光颜色:红色;正向电压(VF):1.6V~2.6V;功率:65mW;正向电流:20mA;主波长:615nm~630nm;二极管配置:独立二极管;透镜颜色:无色透明透镜;色温:-;发光强度:80mcd~220mcd;发光角度:130°;载带方式:-;工作温度:-30℃~+85℃;; Supplier Part: C84263; Manufacturer: 国星光电; Supplier Footprint: 0603; JLCPCB Part Class: 扩展库; Datasheet: https://atta.szlcsc.com/upload/public/pdf/source/20200820/C84263_DABC6A75E58F576973B407FDBA283D60.pdf; Supplier: LCSC; Emitted Color: 红色; Forward Voltage (VF): 1.6V~2.6V; Power Dissipation: 65mW; Forward Current: 20mA; Dominant Wavelength: 615nm~630nm; Diode Configuration: 独立二极管; Lens Color: 无色透明透镜; Luminous Intensity: 80mcd~220mcd; Viewing Angle: 130°; Operating Temperature: -30℃~+85℃; Check: true
P1 = WJ500V-5.08-2P: 结构:1x2P;间距:5.08mm;颜色:绿色;安装方式:直插;额定电流:18A;额定电压:250V;排数:1;线规 - AWG:14~30;线规 - 平方毫米:2.5;每排PIN数:2;触头材质:-;触头镀层:-;工作温度范围:-40℃~+105℃;焊接温度(最大值):-;; LCSC Part Name: 1x2P 5.08mm 直插 排数:1 每排P数:2; Supplier Part: C8465; Manufacturer: KANGNEX(康奈克斯电气); Supplier Footprint: 插件,P=5.08mm; JLCPCB Part Class: 扩展库; Datasheet: https://atta.szlcsc.com/upload/public/pdf/source/20191225/C8465_02D34CE5B5B4A53DF5891601D97FA9F4.pdf; Supplier: LCSC; Structure: 1x2P; Pitch: 5.08mm; Color: 绿色; Mounting Style: 直插; Current Rating (Max): 18A; Voltage Rating (Max): 250V; Number of Pins: 2P; Number of Rows: 1; Wire Gauge - AWG: 14~30; Wire Gauge - mm2: 2.5; Number of PINs Per Row: 2; Operating Temperature Range: -40℃~+105℃; Screw Specification: M2.5
R1 = AR03BTC5003N: 阻值:500kΩ;精度:±0.1%;功率:62.5mW;温度系数:±25ppm/℃;; LCSC Part Name: 500kΩ ±0.1% 62.5mW; Supplier Part: C412382; Manufacturer: Viking(光颉); Supplier Footprint: 0603; JLCPCB Part Class: 扩展库; Datasheet: https://atta.szlcsc.com/upload/public/pdf/source/20191129/C465721_10D49275DB41E427863CE9C8D788770A.pdf; Supplier: LCSC; Tolerance: ±0.1%; Power(Watts): 62.5mW; Temperature Coefficient: ±25ppm/℃
R2-R6 = 0603WAF1003T5E: 电阻类型:厚膜电阻;阻值:100kΩ;精度:±1%;功率:100mW;最大工作电压:75V;温度系数:±100ppm/℃;; LCSC Part Name: 100kΩ ±1% 100mW 厚膜电阻; Supplier Part: C25803; Manufacturer: UNI-ROYAL(厚声); Supplier Footprint: 0603; JLCPCB Part Class: 基础库; Datasheet: https://atta.szlcsc.com/upload/public/pdf/source/20200306/C422600_1E6D84923E4A46A82E41ADD87F860B5C.pdf; Supplier: LCSC; Type: 厚膜电阻; Tolerance: ±1%; Power(Watts): 100mW; Overload Voltage (Max): 75V; Temperature Coefficient: ±100ppm/℃; Operating Temperature Range: -55℃~+155℃
R7 = 0603WAF6803T5E: 电阻类型:厚膜电阻;阻值:680kΩ;精度:±1%;功率:100mW;最大工作电压:75V;温度系数:±100ppm/℃;; LCSC Part Name: 680kΩ ±1% 100mW 厚膜电阻; Supplier Part: C25822; Manufacturer: UNI-ROYAL(厚声); Supplier Footprint: 0603; JLCPCB Part Class: 扩展库; Datasheet: https://atta.szlcsc.com/upload/public/pdf/source/20200306/C422600_1E6D84923E4A46A82E41ADD87F860B5C.pdf; Supplier: LCSC; Type: 厚膜电阻; Tolerance: ±1%; Power(Watts): 100mW; Overload Voltage (Max): 75V; Temperature Coefficient: ±100ppm/℃; Operating Temperature Range: -55℃~+155℃
R8 = 0603WAF3003T5E: 电阻类型:厚膜电阻;阻值:300kΩ;精度:±1%;功率:100mW;最大工作电压:75V;温度系数:±100ppm/℃;; LCSC Part Name: 300kΩ ±1% 100mW 厚膜电阻; Supplier Part: C23024; Manufacturer: UNI-ROYAL(厚声); Supplier Footprint: 0603; JLCPCB Part Class: 基础库; Datasheet: https://atta.szlcsc.com/upload/public/pdf/source/20200306/C422600_1E6D84923E4A46A82E41ADD87F860B5C.pdf; Supplier: LCSC; Type: 厚膜电阻; Tolerance: ±1%; Power(Watts): 100mW; Overload Voltage (Max): 75V; Temperature Coefficient: ±100ppm/℃; Operating Temperature Range: -55℃~+155℃
R9-R12 = FRC0603F1503TS: 电阻类型:厚膜电阻;阻值:150kΩ;精度:±1%;功率:100mW;最大工作电压:75V;温度系数:±100ppm/℃;; LCSC Part Name: 150kΩ ±1% 100mW 厚膜电阻; Supplier Part: C2906993; Manufacturer: FOJAN(富捷); Supplier Footprint: 0603; JLCPCB Part Class: 扩展库; Datasheet: https://atta.szlcsc.com/upload/public/pdf/source/20211221/925EC7D7225764EE0046F22065062C87.pdf; Supplier: LCSC; Type: 厚膜电阻; Tolerance: ±1%; Power(Watts): 100mW; Overload Voltage (Max): 75V; Temperature Coefficient: ±100ppm/℃; Operating Temperature Range: -55℃~+155℃
R34 = 0603WAF4700T5E: 电阻类型:厚膜电阻;阻值:470Ω;精度:±1%;功率:100mW;最大工作电压:75V;温度系数:±100ppm/℃;; LCSC Part Name: 470Ω ±1% 100mW 厚膜电阻; Supplier Part: C23179; Manufacturer: UNI-ROYAL(厚声); Supplier Footprint: 0603; JLCPCB Part Class: 基础库; Datasheet: https://atta.szlcsc.com/upload/public/pdf/source/20200306/C422600_1E6D84923E4A46A82E41ADD87F860B5C.pdf; Supplier: LCSC; Type: 厚膜电阻; Tolerance: ±1%; Power(Watts): 100mW; Overload Voltage (Max): 75V; Temperature Coefficient: ±100ppm/℃; Operating Temperature Range: -55℃~+155℃; Check: true
U2 = MP1584EN-LF-Z: 功能类型:降压型;输出类型:固定;工作电压:4.5V~28V;输出电压:800mV~25V;输出电流:3A;; LCSC Part Name: 3A、1.5MHz、28V降压转换器; Supplier Part: C15051; Manufacturer: MPS(芯源); Supplier Footprint: SOIC-8-EP; JLCPCB Part Class: 扩展库; Datasheet: https://atta.szlcsc.com/upload/public/pdf/source/20240315/437CA6FCECC7F1E554266F7D3B71CA0D.pdf; Supplier: LCSC; Function: 降压型; Output Type: 固定; Input Voltage: 4.5V~28V; Output Voltage: 800mV~25V; Output Current: 3A; Switching Frequency: 100kHz~1.5MHz; Operating Temperature: -20℃~+125℃; Synchronous Rectification: 否; Number of Outputs: 1; Topology: 降压式; Quiescent Current (Iq): 100uA; Switch tube (built-in/external): 内置
U3 = TMI7003C: 功能类型:降压型;输出类型:-;工作电压:2.5V~5.5V;输出电压:-;输出电流:-;; LCSC Part Name: 3通道1.5A 1.5MHz同步降压电源管理IC; Supplier Part: C840566; Manufacturer: TMI(拓尔微); Supplier Footprint: QFN-20-EP(3x3); JLCPCB Part Class: 扩展库; Datasheet: https://atta.szlcsc.com/upload/public/pdf/source/20240902/914C742CD42C12243EC1254263C971AB.pdf; Supplier: LCSC; Function: 降压型; Input Voltage: 2.5V~5.5V; Switching Frequency: 1.5MHz; Operating Temperature: -40℃~+125℃; Topology: 降压式
U6 = AMS1117-3.3_C347222: 输出类型:固定;最大输入电压:18V;输出电压:3.3V;输出电流:1A;电源纹波抑制比(PSRR):60dB@(120Hz);输出极性:正极;; LCSC Part Name: 输出:3.3V 电流:1A 耐压:12V; Supplier Part: C347222; Manufacturer: UMW(友台半导体); Supplier Footprint: SOT-223; JLCPCB Part Class: Extended Part; Datasheet: https://atta.szlcsc.com/upload/public/pdf/source/20231109/155D79A26D9DB04352555A58D5969DC8.pdf; Supplier: LCSC; Output Type: 固定; Maximum Input Voltage: 18V; Output Voltage: 3.3V; Output Current: 1A; Power Supply Rejection Ratio (PSRR): 60dB@(120Hz); Dropout Voltage: 1.3V@(1A); Feature: 过流保护(OCP); Output Polarity: 正极; Number of Outputs: 1; Check: true
FPC1 = AFC01-S10FCA-00: 锁定特性:翻盖式;触点类型:下接;触点数量:10P;间距:0.5mm;安装类型:卧贴;; LCSC Part Name: 间距:0.5mm P数:10P 翻盖式 下接; Supplier Part: C262659; Manufacturer: JS(钜硕电子); Supplier Footprint: SMD,P=0.5mm,卧贴; JLCPCB Part Class: 扩展库; Datasheet: https://atta.szlcsc.com/upload/public/pdf/source/20190816/C413942_2A72D1AC756EAE17EEDF756A339D4500.pdf; Supplier: LCSC; Locking Feature: 翻盖式; Contact Type: 下接; Number of Contacts: 10P; Pitch: 0.5mm; Mounting Type: 卧贴; FFC, FCB Thickness: 0.3mm; Height Above Board: 2mm
U7-U9 = CD4504BPWR: 数据速率:-;电压(VCCA):5V~15V;电压(VCCB):5V~15V;电路数:1;每个电路通道数:6;; LCSC Part Name: 6位单向电平转换器; Supplier Part: C504896; Manufacturer: TI(德州仪器); Supplier Footprint: TSSOP-16; JLCPCB Part Class: 扩展库; Datasheet: https://www.ti.com/cn/lit/gpn/cd4504b; Supplier: LCSC; Channel Type: 单向; Supply Voltage (VCCA): 5V~15V; Supply Voltage (VCCB): 5V~15V; Number of Circuits: 1; Channels per Circuit: 6; Output Type: 非反相; Operating Temperature: -55℃~+125℃
U10 = PZ254-2-14-W-2.5-G1: 插针结构:2x14P;间距:2.54mm;行距:2.54mm;圆针/方针:方针;安装方式:弯插;排数:双排;总PIN位数:28P;额定电流:3A;配合针长度:6mm;塑高:2.5mm;端接针长度:-;工作温度:-40℃~+105℃;颜色:黑色;; LCSC Part Name: 2x14P 间距:2.54mm 方针 弯插; Supplier Part: C18198028; Manufacturer: HCTL(华灿天禄); Supplier Footprint: 弯插,P=2.54mm; JLCPCB Part Class: Extended Part; Datasheet: https://atta.szlcsc.com/upload/public/pdf/source/20230921/EDF240DE1BFF70AE12D0E8E86FBA5889.pdf; Supplier: LCSC; Pin Structure: 2x14P; Pitch: 2.54mm; Row Spacing: 2.54mm; Circluar Pins/Square Pins: 方针; Mounting Type: 弯插; Number of Rows: 双排; Number of Pins: 28P; Current Rating: 3A; Length of Mating Pin: 6mm; Insulation Height: 2.5mm; Operating Temperature: -40℃~+105℃; Color: 黑色
H8 H9 H12 = PZ254V-11-06P: 插针结构:1x6P;间距:2.54mm;行距:-;圆针/方针:方针;安装方式:直插;排数:单排;总PIN位数:6P;额定电流:-;额定电压:-;配合针长度:6mm;塑高:2.5mm;端接针长度:3mm;触头材质:黄铜;触头镀层:-;工作温度:-40℃~+105℃;颜色:黑色;; LCSC Part Name: 1x6P 间距:2.54mm 方针 直插; Supplier Part: C492405; Manufacturer: XFCN(兴飞); Supplier Footprint: 插件,P=2.54mm; JLCPCB Part Class: 扩展库; Datasheet: https://atta.szlcsc.com/upload/public/pdf/source/20200309/C492405_597F1930F5B55CC3C7FD95458F1C3977.pdf; Supplier: LCSC; Pin Structure: 1x6P; Pitch: 2.54mm; Circluar Pins/Square Pins: 方针; Mounting Type: 直插; Number of Rows: 单排; Number of Pins: 6P; Length of Mating Pin: 6mm; Insulation Height: 2.5mm; Length of End Connection Pin: 3mm; Contact Material: 黄铜; Operating Temperature: -40℃~+105℃; Color: 黑色
H10 = HDR-F-2.54_1x8_1: Supplier Part: C225505; Supplier: LCSC; Contributor: LCEDA_Lib; spicePre: H
H11 = HDR-F-2.54_1x8_2: Supplier Part: C225505; Supplier: LCSC; Contributor: LCEDA_Lib; spicePre: H
J2 = HDR-M-2.54_1x2_1: Supplier Part: C124375; Supplier: LCSC; Contributor: LCEDA_Lib; spicePre: J

## Nets
1V2: C14.2 C15.2 L4.2 R11.2
1V8: C8.2 C10.2 L3.2 R8.2
3V32: C7.2 C9.2 C19.2 C35.2 C36.2 C39.1 C40.2 C46.2 C47.2 C48.2 C49.2 C50.2 C51.2 C52.2 CARD1.4(VDD) D5.1(A) H4.10 H5.10 KEY1.4 KEY2.4 KEY3.4 L2.2 P2.7 P3.5 P3.6 R7.2 R13.2 R27.1 R28.1 R29.1 R31.1 R32.1 R33.2 SW1.4 U1.17(VDD) U1.30(VDD) U1.32(VREF+) U1.33(VDDA) U1.39(VDD) U1.52(VDD) U1.62(VDD) U1.72(VDD) U1.84(VDD) U1.95(VDD33USB) U1.108(VDD) U1.121(VDD) U1.131(VDD) U1.144(VDD) U5.5(VCC) U7.1(VCC) U7.13(SELECT) U8.1(VCC) U8.13(SELECT) U9.1(VCC) U9.13(SELECT)
3V32_2: C43.1 C45.1 R34.2 U6.2(VOUT(TAB)) U6.4(TAB)
5V_IN: C3.2 C11.2 C12.2 C13.2 C42.1 C44.1 H8.6 H9.6 H10.6 H12.6 L1.2 R1.2 U3.7(VIN2) U3.8(EN2) U3.9(EN1) U3.10(VIN1) U3.18(EN3) U3.19(VIN3) U6.3(VIN) U7.16(VDD) U8.16(VDD) U9.16(VDD) USB1.2(VBUS) USB1.11(VBUS) USB2.2(VBUS) USB2.11(VBUS)
GND: C3.1 C5.1 C6.1 C9.1 C10.1 C11.1 C12.1 C13.1 C15.1 C16.2 C17.1 C18.2 C19.1 C20.1 C33.2 C34.2 C35.1 C36.1 C37.2 C38.2 C39.2 C40.1 C41.1 C42.2 C43.2 C44.2 C45.2 C46.1 C47.1 C48.1 C49.1 C50.1 C51.1 C52.1 C56.2 C57.1 C58.2 CARD1.6(VSS) CARD1.10 CARD1.11 CARD1.12 CARD1.13 CARD1.CD D1.2(A) D2.2(A) FPC1.1 FPC1.3 FPC1.5 FPC1.7 FPC1.9 FPC1.10 FPC1.11 FPC1.12 H4.9 H5.9 H6.3 H7.3 H8.1 H9.1 H10.5 H12.2 H12.4 H12.5 KEY1.1 KEY1.2 KEY2.1 KEY2.2 KEY3.1 KEY3.2 LED1.1(K) P1.2 P2.8 P3.3 P3.7 P3.8 R3.1 R4.1 R5.1 R6.1 R9.1 R10.1 R12.1 R14.1 R15.1 R16.1 R17.1 R18.1 R36.1 R37.1 R38.1 RST.1 RST.2 RST.3 SW1.1 SW1.2 U1.16(VSS) U1.31(VSSA) U1.38(VSS) U1.51(VSS) U1.61(VSS) U1.83(VSS) U1.94(VSS) U1.107(VSS) U1.120(VSS) U1.130(VSS) U2.5(GND) U2.9(EP) U3.21(EP) U5.3(GND) U6.1(ADJ(GND)) U7.8(VSS) U8.8(VSS) U9.8(VSS) U10.22 U10.24 U10.26 U10.28 USB1.1(GND) USB1.12(GND) USB1.13(SHELL) USB1.14(SHELL) USB2.1(GND) USB2.12(GND) USB2.13(SHELL) USB2.14(SHELL) X1.2(GND) X1.4(GND)
VBAT: D4.1(A)
VIN: C5.2 C6.2 D1.1(K) P1.1 R2.2 U2.7(VIN) U10.21 U10.23 U10.25 U10.27
BOOT0: R14.2 SW1.3 U1.138(BOOT0)
BUSY: H10.2
CH340_RX: H1.2 R19.2
CH340_TX: H2.2 R21.2
EN: R2.1 R5.2 U2.2(EN)
FB1: C8.1 R8.1 R10.2 U3.14(FB1)
FB2: C7.1 R7.1 R9.2 U3.3(FB2)
FB3: C14.1 R11.1 R12.2 U3.2(FB3)
FB4: R1.1 R6.2 U2.4(FB)
OSC32_IN: C33.1 U1.8(PC14-OSC32_IN) X3.2(OSC2)
OSC32_OUT: C34.1 U1.9(PC15-OSC32_OUT) X3.1(OSC1)
OSC_IN: C17.2 U1.23(PH0-OSC_IN) X1.3(OSC2)
OSC_OUT: C16.1 U1.24(PH1-OSC_OUT) X1.1(OSC1)
PA0_UART4_TX: H6.1 U1.34(PA0)
PA1_UART4_RX: H6.2 U1.35(PA1)
PA2_TIM2_CH3: U1.36(PA2) U10.18
PA7_ADC1_INP7: U1.43(PA7)
PA9_USART1_TX: H1.3 U1.101(PA9)
PA10_USART1_RX: H2.3 U1.102(PA10)
PA13_SWD_TMS: P3.4 U1.105(PA13)
PA14_SWD_CLK: P3.2 U1.109(PA14)
PB0_ADC1_INP9: U1.46(PB0)
PB1_ADC1_INP5: U1.47(PB1)
PB3_SPI3_SCK: P2.6 U1.133(PB3)
PB5_SPI3_MOSI: P2.5 U1.135(PB5)
PB6_I2C1_SCL: H12.3 U1.136(PB6)
PB7_I2C1_SDA: H12.1 U1.137(PB7)
PB11_TIM2_CH4: U1.70(PB11) U10.20
PB12_HSPI_CK: U1.126(PG11)
PB12_UART5_RX: H7.2 U1.73(PB12)
PB13_HSPI_INT: U1.127(PG12)
PB13_UART5_TX: H7.1 U1.74(PB13)
PB14_DIR: H5.3 U1.75(PB14) U8.11(EIN)
PB14_DIR_CONV: U8.12(EOUT) U10.6
PB14_HSPI_CS: U1.125(PG10)
PB15_DIR: H5.4 U1.76(PB15) U8.14(FIN)
PB15_DIR_CONV: U8.15(FOUT) U10.8
PB15_HSPI_DI: U1.123(PD7)
PB16_HSPI_DO: U1.124(PG9)
PB19_TX0: H1.1
PB20_RX0: H2.1
PC0_ADC1_INP10: U1.26(PC0)
PC4_ADC1_INP4: U1.44(PC4)
PC5_ADC1_INP8: U1.45(PC5)
PC6_TIM3_CH1: U1.96(PC6) U10.17
PC7_TIM3_CH2: U1.97(PC7) U10.19
PC8_SDMMC1_D0: CARD1.7(DAT0) R29.2 U1.98(PC8)
PC9_SDMMC1_D1: CARD1.8(DAT1) R32.2 U1.99(PC9)
PC10_SDMMC1_D2: CARD1.1(DAT2) R31.2 U1.111(PC10)
PC11_SDMMC1_D3: CARD1.2(CD/DAT3) R27.2 U1.112(PC11)
PC12_SDMMC1_CK: CARD1.5(CLX) U1.113(PC12)
PD2_SDMMC1_CMD: CARD1.3(CMD) R28.2 U1.116(PD2)
PD8_DIR: H5.5 U1.77(PD8) U9.3(AIN)
PD8_DIR_CONV: U9.2(AOUT) U10.10
PD9_DIR: H5.6 U1.78(PD9) U9.5(BIN)
PD9_DIR_CONV: U9.4(BOUT) U10.12
PD10_DIR: H5.7 U1.79(PD10) U9.7(CIN)
PD10_DIR_CONV: U9.6(COUT) U10.14
PD11_DIR: H5.8 U1.80(PD11) U9.9(DIN)
PD11_DIR_CONV: U9.10(DOUT) U10.16
PD12_TIM4_CH1: H4.5 U1.81(PD12) U7.11(EIN)
PD12_TIM4_CH1_CONV: U7.12(EOUT) U10.9
PD13_TIM4_CH2: H4.6 U1.82(PD13) U7.14(FIN)
PD13_TIM4_CH2_CONV: U7.15(FOUT) U10.11
PD14_TIM4_CH3: H4.7 U1.85(PD14) U8.3(AIN)
PD14_TIM4_CH3_CONV: U8.2(AOUT) U10.13
PD15_TIM4_CH4: H4.8 U1.86(PD15) U8.5(BIN)
PD15_TIM4_CH4_CONV: U8.4(BOUT) U10.15
PE0_UART8_RX: H10.4 U1.141(PE0)
PE1_UART8_TX: H10.3 U1.142(PE1)
PE2_EXIT2_KEY1: C58.1 KEY1.3 R36.2 U1.1(PE2)
PE3_EXIT3_KEY2: C57.2 KEY2.3 R37.2 U1.2(PE3)
PE4_EXIT4_KEY3: C56.1 KEY3.3 R38.2 U1.3(PE4)
PE9_TIM1_CH1: H4.1 U1.60(PE9) U7.3(AIN)
PE9_TIM1_CH1_CONV: U7.2(AOUT) U10.1
PE10_DIR: H5.1 U1.63(PE10) U8.7(CIN)
PE10_DIR_CONV: U8.6(COUT) U10.2
PE11_TIM1_CH2: H4.2 U1.64(PE11) U7.5(BIN)
PE11_TIM1_CH2_CONV: U7.4(BOUT) U10.3
PE12_DIR: H5.2 U1.65(PE12) U8.9(DIN)
PE12_DIR_CONV: U8.10(DOUT) U10.4
PE13_TIM1_CH3: H4.3 U1.66(PE13) U7.7(CIN)
PE13_TIM1_CH3_CONV: U7.6(COUT) U10.5
PE14_TIM1_CH4: H4.4 U1.67(PE14) U7.9(DIN)
PE14_TIM1_CH4_CONV: U7.10(DOUT) U10.7
PF0_I2C2_SDA: FPC1.6 U1.10(PF0)
PF1_I2C2_SCL: FPC1.8 U1.11(PF1)
PF6_UART7_RX: H8.2 H9.2 U1.18(PF6)
PF7_UART7_TX: H8.3 H9.3 U1.19(PF7)
PF11_ADC1_INP2: U1.49(PF11)
PF12_ADC1_INP6: U1.50(PF12)
PF14_I2C4_SCL: FPC1.4 U1.54(PF14)
PF15_I2C4_SDA: FPC1.2 U1.55(PF15)
PG13_SPI3_CS: P2.2 U1.128(PG13)
PG14_DC: P2.3 U1.129(PG14)
PG15_RES: P2.4 U1.132(PG15)
RESET: C18.1 P3.1 R13.1 R20.1 RST.4 U1.25(NRST)
SPK+: H10.8 J2.1
SPK-: H10.7 J2.2
SW1: L3.1 U3.11(SW1)
SW2: L2.1 U3.6(SW2)
SW3: L4.1 U3.20(SW3)
SW4: C1.2 D2.1(K) L1.1 U2.1(SW)
UD2+: U5.1(UD+) USB2.6(DP1) USB2.8(DP2)
UD2-: U5.2(UD-) USB2.5(DN2) USB2.7(DN1)
UD+: U1.104(PA12) USB1.6(DP1) USB1.8(DP2)
UD-: U1.103(PA11) USB1.5(DN2) USB1.7(DN1)
VPP: H10.1
$1N2342: R15.2 USB1.4(CC1)
$1N2433: R16.2 USB1.10(CC2)
$1N3026: R17.2 USB2.4(CC1)
$1N3032: R18.2 USB2.10(CC2)
$1N3369: R21.1 U5.6(TXD)
$1N3371: R20.2 U5.4(RTS#)
$1N3372: C20.2 U5.8(V3)
$1N3373: R19.1 U5.7(RXD)
$1N5920: C37.1 U1.106(VCAP)
$1N6077: R33.1 U1.143(PDR_ON)
$1N6160: C38.1 D4.2(K) D5.2(K) U1.6(VBAT)
$1N6699: C41.2 U1.71(VCAP)
$2N901: C1.1 U2.8(BST)
$2N906: C2.2 U2.3(COMP)
$2N907: C2.1 R4.2
$2N910: R3.2 U2.6(FREQ)
$2N3702: LED1.2(A) R34.1

Not connected (* = marked no-connect by the designer): H8 4* 5*; H9 4* 5*; H11 1* 2* 3* 4* 5* 6* 7* 8*; P2 1*; U1 4(PE5) 5(PE6) 7(PC13) 12(PF2) 13(PF3) 14(PF4) 15(PF5) 20(PF8) 21(PF9) 22(PF10) 27(PC1) 28(PC2_C) 29(PC3_C) 37(PA3) 40(PA4) 41(PA5) 42(PA6) 48(PB2) 53(PF13) 56(PG0) 57(PG1) 58(PE7) 59(PE8) 68(PE15) 69(PB10) 87(PG2) 88(PG3) 89(PG4) 90(PG5) 91(PG6) 92(PG7) 93(PG8) 100(PA8) 110(PA15) 114(PD0) 115(PD1) 117(PD3) 118(PD4) 119(PD5) 122(PD6) 134(PB4) 139(PB8) 140(PB9); U3 1(NC)* 4(NC)* 5(NC)* 12(NC)* 13(NC)* 15(NC)* 16(NC)* 17(NC)*; U9 11(EIN)* 12(EOUT)* 14(FIN)* 15(FOUT)*; USB1 3(SBU2)* 9(SBU1)*; USB2 3(SBU2)* 9(SBU1)*

## Notes on the sheets
sheet 1
- BOOT0待确认
- 双芯片串口切换
- STM32 USB_P/USB_N直接连接?
- 屏幕
sheet 2
- 宽电压输入
- 宽电压转换
- 电源5V
- 电源3.3V
- 电源1.8v
- 多通道降压 MCU/FPGA电源
- 电源3.3V_2
- 电源1.2v
sheet 4
- 备用
- 二维码识别
- 备用
- 语音模块
- 喇叭接口
